# Altium schematic sheet Regulator_Section.SchDoc
size A4; DocumentNumber: 5; SheetNumber: 5; SheetTotal: 6
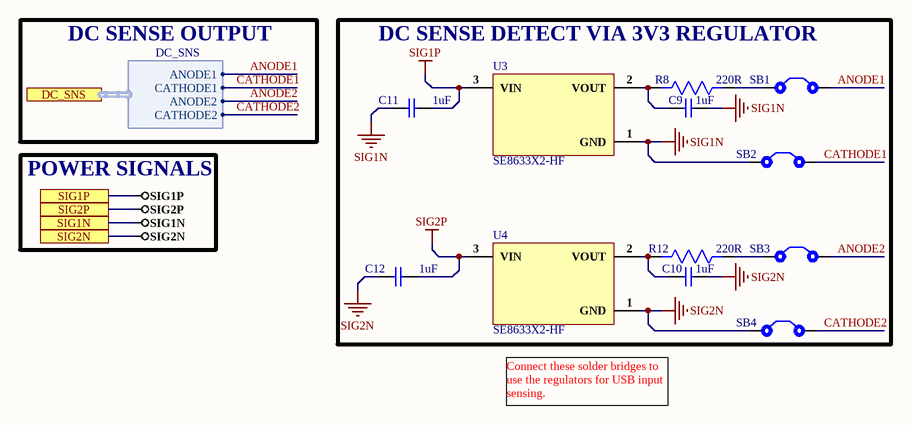
[diagram p0: Regulator_Section.SchDoc]

## Parts
C9  1uF  [Cap1206]
C10  1uF  [Cap1206]
C11  1uF  [Cap1206]
C12  1uF  [Cap1206]
R8  220R  [Res0603]
R12  220R  [Res0603]
SB1  Solder Bridge  [Solder Bridge]  (value not drawn)
SB2  Solder Bridge  [Solder Bridge]  (value not drawn)
SB3  Solder Bridge  [Solder Bridge]  (value not drawn)
SB4  Solder Bridge  [Solder Bridge]  (value not drawn)
U3  SE8633X2-HF  [SOT23-3]
U4  SE8633X2-HF  [SOT23-3]

## Blocks framed on the sheet
DC SENSE DETECT VIA 3V3 REGULATOR: C9-C12 R8 R12 SB1-SB4 U3 U4

## Ports
DC_SNS (harness DC_SNS), SIG1N, SIG1P, SIG2N, SIG2P

## Harnesses
DC_SNS: ANODE1, CATHODE1, ANODE2, CATHODE2

## Nets
SIG1N: C9.2 C11.1 SB2.1 U3.1(GND) ; port SIG1N
SIG1P: C11.2 U3.3(VIN) ; port SIG1P
SIG2N: C10.2 C12.1 SB4.1 U4.1(GND) ; port SIG2N
SIG2P: C12.2 U4.3(VIN) ; port SIG2P
ANODE1: SB1.2 ; port DC_SNS.ANODE1
ANODE2: SB3.2 ; port DC_SNS.ANODE2
CATHODE1: SB2.2 ; port DC_SNS.CATHODE1
CATHODE2: SB4.2 ; port DC_SNS.CATHODE2
NetC9_1: C9.1 R8.1 U3.2(VOUT)
NetC10_1: C10.1 R12.1 U4.2(VOUT)
NetR8_2: R8.2 SB1.1
NetR12_2: R12.2 SB3.1

## Notes on the sheet
- DC SENSE OUTPUT
- POWER SIGNALS
- (near U4) Connect these solder bridges to use the regulators for USB input sensing.

## Library data of the parts
C9-C12 = CL31B105KCHNNNE: CAP CER 1UF 100V X7R 1206; Manufacturer: Samsung Electro-Mechanics; Value: 1206; Manufacturer Part No:: CL31B105KCHNNNE; Package: 1206; ComponentLink1Description: New link; ComponentLink1URL: https://lcsc.com/product-detail/Multilayer-Ceramic-Capacitors-MLCC-SMD-SMT_Samsung-Electro-Mechanics-CL31B105KCHNNNE_C13832.html
R8 R12 = RMCF0603JT220R: RES 220 OHM 5% 1/10W 0603; Manufacturer: Stackpole Electronics; Power Rating: 100mW; Temperature Coefficient: 100ppm/°C; Supplier 1: Digi-Key; Manufacturer Part Number: RMCF0603JT220R; RoHS: Yes; Category: Chip SMD Resistors; Stock 1: 108307; Pricing 1: 1=0.10000, 10=0.01500, 100=0.00610, 1000=0.00274, 2500=0.00238 (USD); Mount: Surface Mount; Case/Package: 0603; Case Code (Metric): 1608; Case Code (Imperial): 0603; Contact Plating: Tin,Matte; Size Code: 0603; Min Operating Temperature: -55°C; Max Operating Temperature: 155°C; Resistance: 220R; Tolerance: 5%; Packaging: Tape and Reel; Resistor Type: Thick Film; Number of Terminations: 2; Max Power Dissipation: 100mW; Features: Automotive AEC-Q200; Series: RMCF; Construction: Rectangular; Length: 1.55mm; Width: 0.031inch; Height: 0.022inch; Depth: 0.8mm; Radiation Hardening: No; Military Standard: Not; Lead Free: Lead Free; RoHS Compliant: Yes; ComponentLink1URL: https://datasheet.ciiva.com/26835/getdatasheetpartid-362043-26835658.pdf?src-supplier=Verical; ComponentLink1Description: https://datasheet.ciiva.com/26835/getdatasheetpartid-362043-26835658.pdf?src-supplier=Verical; Supplier Part Number 1: RMCF0603JT220RCT-ND
SB1-SB4 = Solder Bridge: Solder Bridge ON
U3 U4 = SE8633X2-HF: Fixed 3.3V~3.3V Positive 1 80V SOT23-3 Linear Voltage Regulators (LDO) ROHS; Manufacturer: Seaward Elec; Manufacturer Part No:: C496613; ComponentLink1Description: New link; ComponentLink1URL: https://lcsc.com/product-detail/Linear-Voltage-Regulators-LDO_Seaward-Elec-SE8633X2-HF_C496613.html; Footprint: SOT-23-3